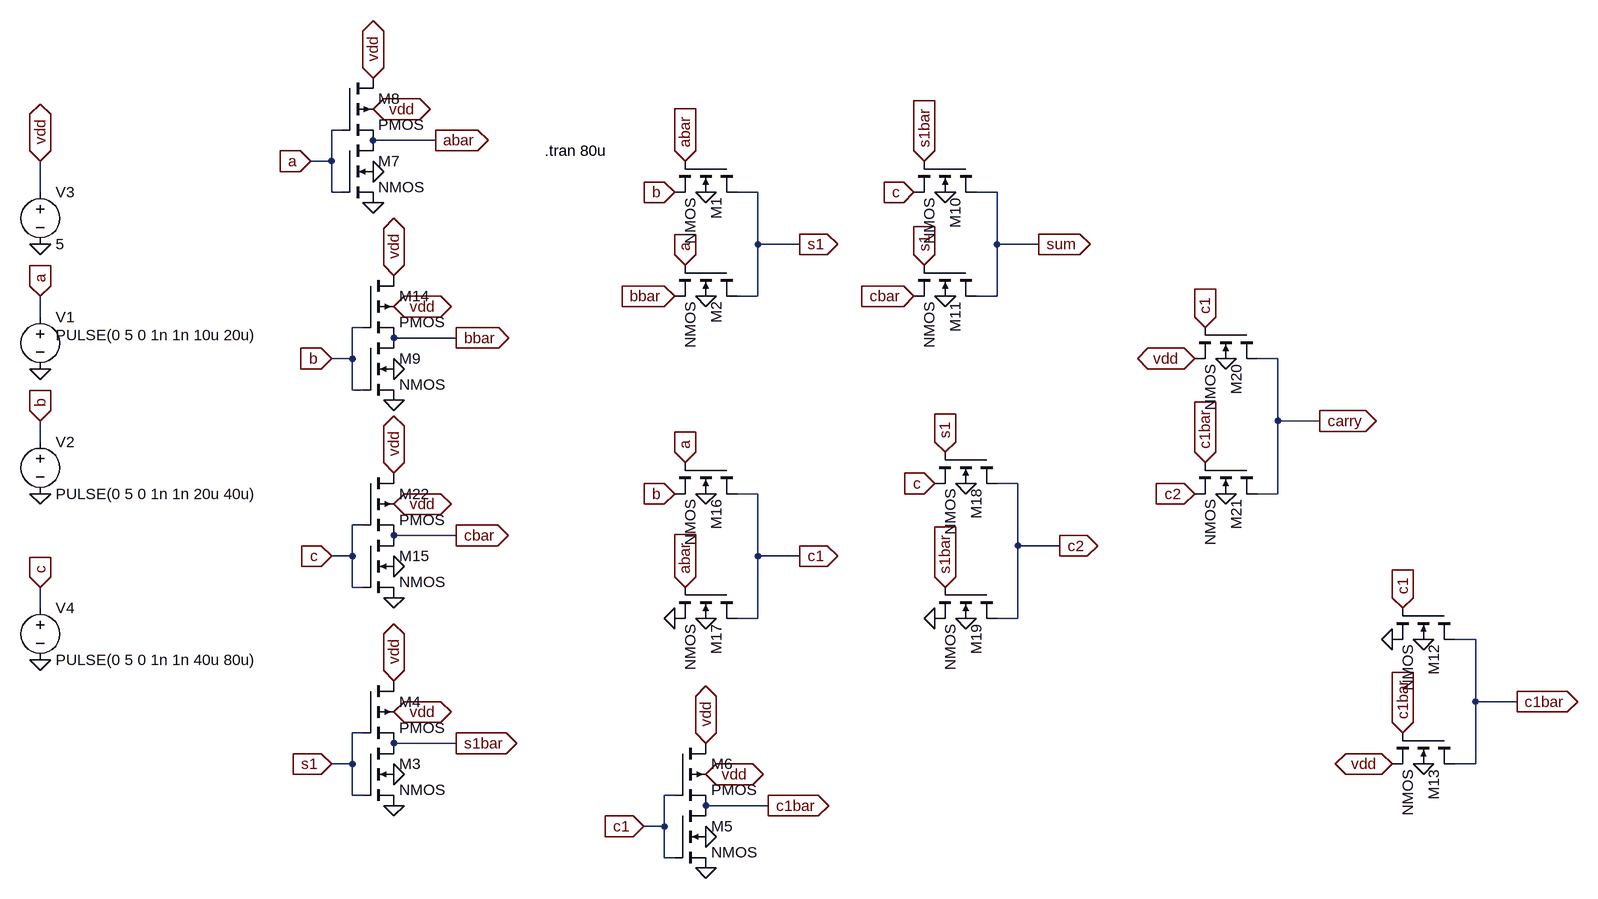
[diagram p0: schematic passtran.asc]
passtran.asc, the LTspice schematic file:
Version 4.1
SHEET 1 2300 932
WIRE 160 -368 144 -368
WIRE 304 -352 208 -352
WIRE 144 -320 144 -368
WIRE 144 -320 112 -320
WIRE -304 -272 -304 -320
WIRE 144 -272 144 -320
WIRE 160 -272 144 -272
WIRE 800 -272 768 -272
WIRE 1168 -272 1136 -272
WIRE 800 -192 800 -272
WIRE 864 -192 800 -192
WIRE 1168 -192 1168 -272
WIRE 1232 -192 1168 -192
WIRE 800 -112 800 -192
WIRE 800 -112 768 -112
WIRE 1168 -112 1168 -192
WIRE 1168 -112 1136 -112
WIRE -304 -80 -304 -112
WIRE 192 -64 176 -64
WIRE 336 -48 240 -48
WIRE 176 -16 176 -64
WIRE 176 -16 144 -16
WIRE 1600 -16 1568 -16
WIRE 176 32 176 -16
WIRE 192 32 176 32
WIRE 1600 80 1600 -16
WIRE 1664 80 1600 80
WIRE -304 112 -304 80
WIRE 1200 176 1168 176
WIRE 800 192 768 192
WIRE 1600 192 1600 80
WIRE 1600 192 1568 192
WIRE 192 240 176 240
WIRE 336 256 240 256
WIRE 1200 272 1200 176
WIRE 1264 272 1200 272
WIRE 176 288 176 240
WIRE 176 288 144 288
WIRE 800 288 800 192
WIRE 864 288 800 288
WIRE 176 336 176 288
WIRE 192 336 176 336
WIRE -304 368 -304 336
WIRE 800 384 800 288
WIRE 800 384 768 384
WIRE 1200 384 1200 272
WIRE 1200 384 1168 384
WIRE 1904 416 1872 416
WIRE 1904 512 1904 416
WIRE 1968 512 1904 512
WIRE 192 560 176 560
WIRE 336 576 240 576
WIRE 176 608 176 560
WIRE 176 608 144 608
WIRE 1904 608 1904 512
WIRE 1904 608 1872 608
WIRE 176 656 176 608
WIRE 192 656 176 656
WIRE 672 656 656 656
WIRE 816 672 720 672
WIRE 656 704 656 656
WIRE 656 704 624 704
WIRE 656 752 656 704
WIRE 672 752 656 752
FLAG -304 -112 a
IOPIN -304 -112 In
FLAG -304 80 b
IOPIN -304 80 In
FLAG -304 -320 vdd
IOPIN -304 -320 BiDir
FLAG -304 -192 0
FLAG -304 0 0
FLAG -304 192 0
FLAG 688 -160 a
IOPIN 688 -160 In
FLAG 672 -112 bbar
IOPIN 672 -112 In
FLAG -304 448 0
FLAG -304 336 c
IOPIN -304 336 In
FLAG 688 -320 abar
IOPIN 688 -320 In
FLAG 672 -272 b
IOPIN 672 -272 In
FLAG 720 -272 0
FLAG 720 -112 0
FLAG 864 -192 s1
IOPIN 864 -192 Out
FLAG 1088 -272 0
FLAG 1088 -112 0
FLAG 1232 -192 sum
IOPIN 1232 -192 Out
FLAG 144 608 s1
IOPIN 144 608 In
FLAG 1056 -320 s1bar
IOPIN 1056 -320 In
FLAG 1056 -160 s1
IOPIN 1056 -160 In
FLAG 1040 -112 cbar
IOPIN 1040 -112 In
FLAG 1040 -272 c
IOPIN 1040 -272 In
FLAG 688 144 a
IOPIN 688 144 In
FLAG 672 192 b
IOPIN 672 192 In
FLAG 672 384 0
FLAG 688 336 abar
IOPIN 688 336 In
FLAG 864 288 c1
IOPIN 864 288 Out
FLAG 720 384 0
FLAG 1088 128 s1
IOPIN 1088 128 In
FLAG 1072 176 c
IOPIN 1072 176 In
FLAG 1072 384 0
FLAG 1120 384 0
FLAG 1264 272 c2
IOPIN 1264 272 Out
FLAG 1088 336 s1bar
IOPIN 1088 336 In
FLAG 1520 192 0
FLAG 1664 80 carry
IOPIN 1664 80 Out
FLAG 1120 176 0
FLAG 720 192 0
FLAG 1520 -16 0
FLAG 1488 -64 c1
IOPIN 1488 -64 In
FLAG 1472 192 c2
IOPIN 1472 192 In
FLAG 1472 -16 vdd
IOPIN 1472 -16 BiDir
FLAG 1792 368 c1
IOPIN 1792 368 In
FLAG 1792 560 c1bar
IOPIN 1792 560 In
FLAG 1488 144 c1bar
IOPIN 1488 144 In
FLAG 304 -352 abar
IOPIN 304 -352 Out
FLAG 336 -48 bbar
IOPIN 336 -48 Out
FLAG 144 -16 b
IOPIN 144 -16 In
FLAG 336 576 s1bar
IOPIN 336 576 Out
FLAG 1824 608 0
FLAG 1824 416 0
FLAG 1776 416 0
FLAG 1776 608 vdd
IOPIN 1776 608 BiDir
FLAG 1968 512 c1bar
IOPIN 1968 512 Out
FLAG 208 -448 vdd
IOPIN 208 -448 BiDir
FLAG 112 -320 a
IOPIN 112 -320 In
FLAG 208 -400 vdd
IOPIN 208 -400 BiDir
FLAG 208 -304 0
FLAG 208 -256 0
FLAG 240 -144 vdd
IOPIN 240 -144 BiDir
FLAG 240 -96 vdd
IOPIN 240 -96 BiDir
FLAG 240 0 0
FLAG 240 48 0
FLAG 240 160 vdd
IOPIN 240 160 BiDir
FLAG 240 208 vdd
IOPIN 240 208 BiDir
FLAG 240 304 0
FLAG 240 352 0
FLAG 144 288 c
IOPIN 144 288 In
FLAG 336 256 cbar
IOPIN 336 256 Out
FLAG 240 480 vdd
IOPIN 240 480 BiDir
FLAG 240 528 vdd
IOPIN 240 528 BiDir
FLAG 240 624 0
FLAG 240 672 0
FLAG 720 576 vdd
IOPIN 720 576 BiDir
FLAG 720 624 vdd
IOPIN 720 624 BiDir
FLAG 720 720 0
FLAG 720 768 0
FLAG 624 704 c1
IOPIN 624 704 In
FLAG 816 672 c1bar
IOPIN 816 672 Out
SYMBOL voltage -304 -96 R0
WINDOW 3 24 44 Left 2
WINDOW 123 0 0 Left 0
WINDOW 39 0 0 Left 0
SYMATTR Value PULSE(0 5 0 1n 1n 10u 20u)
SYMATTR InstName V1
SYMBOL voltage -304 96 R0
WINDOW 123 0 0 Left 0
WINDOW 39 0 0 Left 0
SYMATTR InstName V2
SYMATTR Value PULSE(0 5 0 1n 1n 20u 40u)
SYMBOL voltage -304 -288 R0
WINDOW 123 0 0 Left 0
WINDOW 39 0 0 Left 0
SYMATTR InstName V3
SYMATTR Value 5
SYMBOL voltage -304 352 R0
WINDOW 123 0 0 Left 0
WINDOW 39 0 0 Left 0
SYMATTR InstName V4
SYMATTR Value PULSE(0 5 0 1n 1n 40u 80u)
SYMBOL nmos4 768 -320 R90
SYMATTR InstName M1
SYMATTR Value2 l=32n w=96n
SYMBOL nmos4 768 -160 R90
SYMATTR InstName M2
SYMATTR Value2 l=32n w=96n
SYMBOL nmos4 1136 -320 R90
SYMATTR InstName M10
SYMATTR Value2 l=32n w=96n
SYMBOL nmos4 1136 -160 R90
SYMATTR InstName M11
SYMATTR Value2 l=32n w=96n
SYMBOL nmos4 768 144 R90
SYMATTR InstName M16
SYMATTR Value2 l=32n w=96n
SYMBOL nmos4 768 336 R90
SYMATTR InstName M17
SYMATTR Value2 l=32n w=96n
SYMBOL nmos4 1168 128 R90
SYMATTR InstName M18
SYMATTR Value2 l=32n w=96n
SYMBOL nmos4 1168 336 R90
SYMATTR InstName M19
SYMATTR Value2 l=32n w=96n
SYMBOL nmos4 1568 -64 R90
SYMATTR InstName M20
SYMATTR Value2 l=32n w=96n
SYMBOL nmos4 1568 144 R90
SYMATTR InstName M21
SYMATTR Value2 l=32n w=96n
SYMBOL nmos4 1872 368 R90
SYMATTR InstName M12
SYMATTR Value2 l=32n w=96n
SYMBOL nmos4 1872 560 R90
SYMATTR InstName M13
SYMATTR Value2 l=32n w=96n
SYMBOL nmos4 160 -352 R0
SYMATTR InstName M7
SYMATTR Value2 w=96n
SYMBOL pmos4 160 -448 R0
SYMATTR InstName M8
SYMATTR Value2 l=32n w=96n
SYMBOL nmos4 192 -48 R0
SYMATTR InstName M9
SYMATTR Value2 l=32n w=96n
SYMBOL pmos4 192 -144 R0
SYMATTR InstName M14
SYMATTR Value2 l=32n w=96n
SYMBOL nmos4 192 256 R0
SYMATTR InstName M15
SYMATTR Value2 l=32n w=96n
SYMBOL pmos4 192 160 R0
SYMATTR InstName M22
SYMATTR Value2 l=32n w=96n
SYMBOL nmos4 192 576 R0
SYMATTR InstName M3
SYMATTR Value2 l=32n w=96n
SYMBOL pmos4 192 480 R0
SYMATTR InstName M4
SYMATTR Value2 l=32n w=96n
SYMBOL nmos4 672 672 R0
SYMATTR InstName M5
SYMATTR Value2 l=32n w=96n
SYMBOL pmos4 672 576 R0
SYMATTR InstName M6
SYMATTR Value2 l=32n w=96n
TEXT 472 -336 Left 2 !.tran 80u

The netlist it stands for:
* passtran.asc
V1 a 0 PULSE(0 5 0 1n 1n 10u 20u)
V2 b 0 PULSE(0 5 0 1n 1n 20u 40u)
V3 vdd 0 5
V4 c 0 PULSE(0 5 0 1n 1n 40u 80u)
M1 s1 abar b 0 NMOS l=32n w=96n
M2 s1 a bbar 0 NMOS l=32n w=96n
M10 sum s1bar c 0 NMOS l=32n w=96n
M11 sum s1 cbar 0 NMOS l=32n w=96n
M16 c1 a b 0 NMOS l=32n w=96n
M17 c1 abar 0 0 NMOS l=32n w=96n
M18 c2 s1 c 0 NMOS l=32n w=96n
M19 c2 s1bar 0 0 NMOS l=32n w=96n
M20 carry c1 vdd 0 NMOS l=32n w=96n
M21 carry c1bar c2 0 NMOS l=32n w=96n
M12 c1bar c1 0 0 NMOS l=32n w=96n
M13 c1bar c1bar vdd 0 NMOS l=32n w=96n
M7 abar a 0 0 NMOS w=96n
M8 vdd a abar vdd PMOS l=32n w=96n
M9 bbar b 0 0 NMOS l=32n w=96n
M14 vdd b bbar vdd PMOS l=32n w=96n
M15 cbar c 0 0 NMOS l=32n w=96n
M22 vdd c cbar vdd PMOS l=32n w=96n
M3 s1bar s1 0 0 NMOS l=32n w=96n
M4 vdd s1 s1bar vdd PMOS l=32n w=96n
M5 c1bar c1 0 0 NMOS l=32n w=96n
M6 vdd c1 c1bar vdd PMOS l=32n w=96n
.model NMOS NMOS
.model PMOS PMOS
.lib standard.mos
.tran 80u
.backanno
.end

* Results of the author's LTspice run, read from the files saved beside the schematic
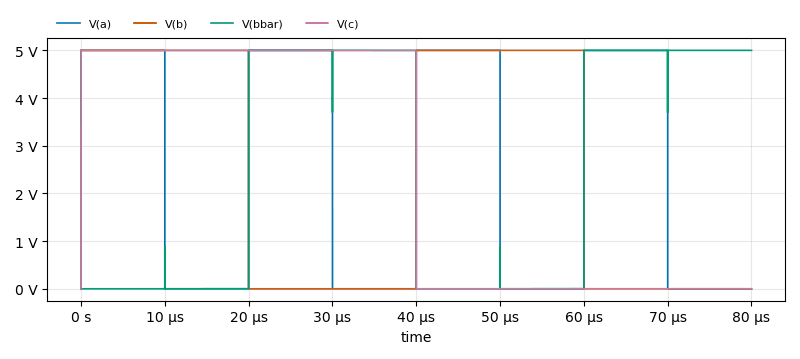
[diagram p1: Transient Analysis of passtran.asc, plotted from the saved traces]
* Transient Analysis, 1 run:
*   V(a): min 0 V, max 5 V, average 2.5 V, rms 3.536 V, last 0 V
*   V(b): min 0 V, max 5 V, average 2.5 V, rms 3.536 V, last 0 V
*   V(bbar): min 0 V, max 5 V, average 2.5 V, rms 3.535 V, last 5 V
*   V(c): min 0 V, max 5 V, average 2.5 V, rms 3.536 V, last 0 V